# Altium schematic sheet Peripherals.SchDoc
size A4; SheetNumber: 4; SheetTotal: 6
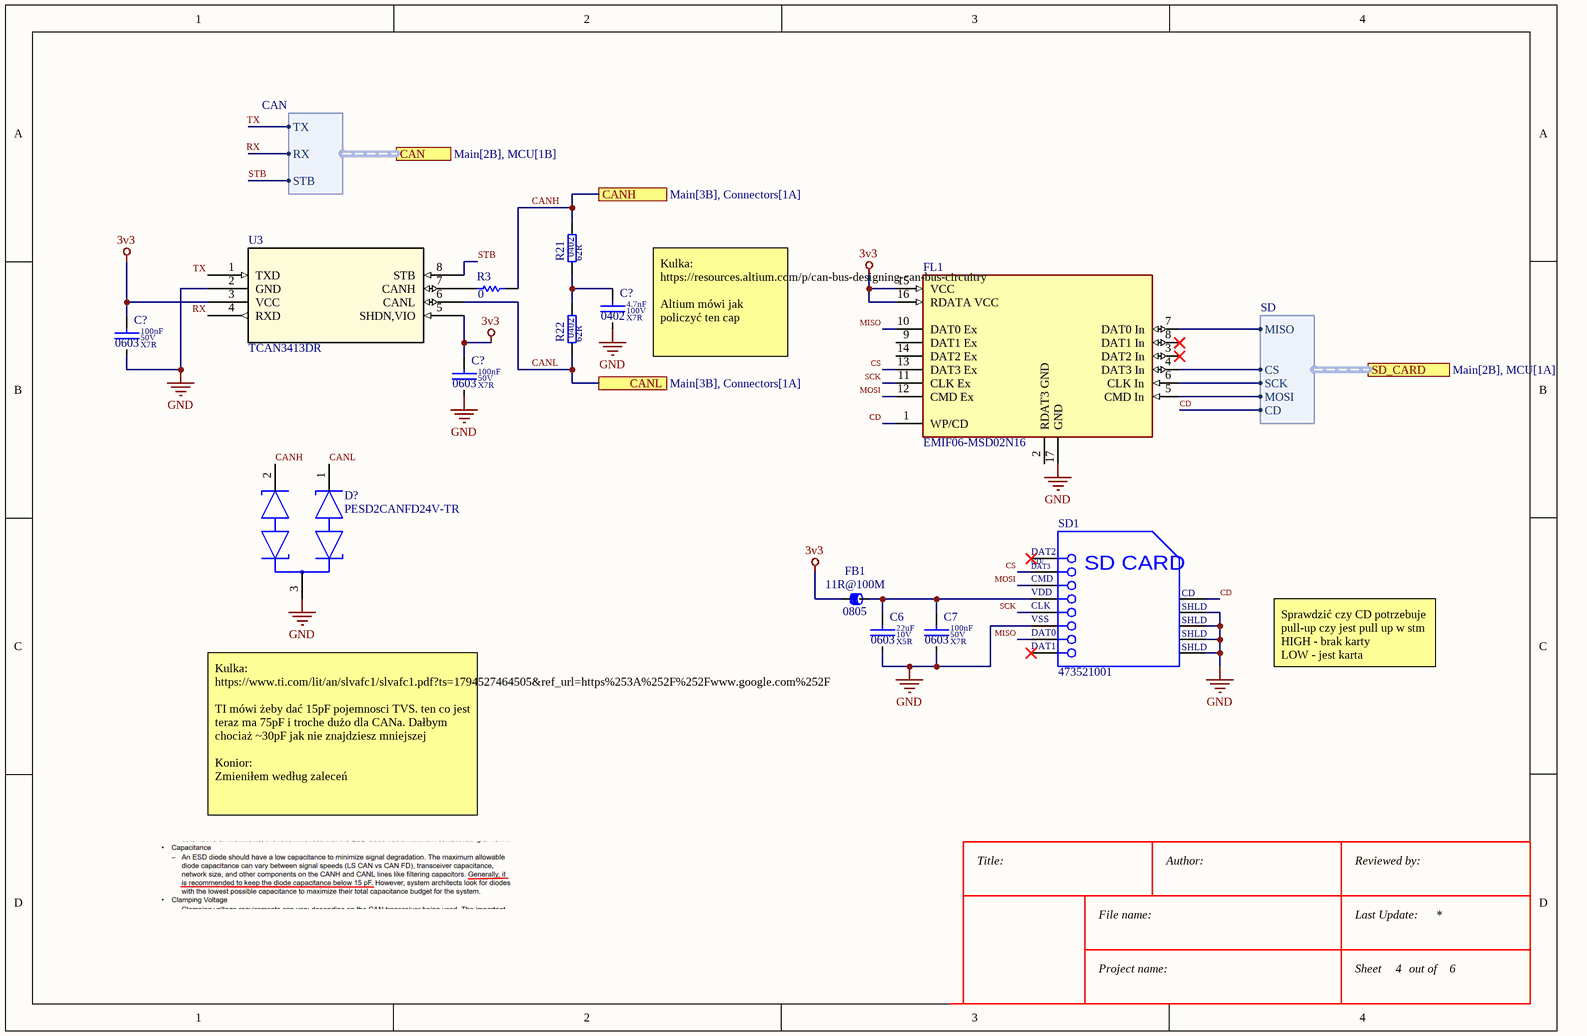
[diagram p0: Peripherals.SchDoc]

## Parts
(Parts that share a designator on the sheet are numbered #1, #2 ... from top to bottom, then left to right.)
C6  value 22uF  Dielectric: X5R  Voltage: 10V  SCH_Footprint: 0603  [C_0603_1608]  (hidden comment: Ceramic X5R)
C7  value 100nF  Dielectric: X7R  Voltage: 50V  SCH_Footprint: 0603  [C_0603_1608]  (hidden comment: Ceramic X7R)
C?#1  value 4.7nF  Dielectric: X7R  Voltage: 100V  SCH_Footprint: 0402  [C_0402_1005]  (hidden comment: Ceramic X7R)
C?#2  value 100nF  Dielectric: X7R  Voltage: 50V  SCH_Footprint: 0603  [C_0603_1608]  (hidden comment: Ceramic X7R)
C?#3  value 100nF  Dielectric: X7R  Voltage: 50V  SCH_Footprint: 0603  [C_0603_1608]  (hidden comment: Ceramic X7R)
D?  PESD2CANFD24V-TR  [FP-SOT23-IPC_A]
FB1  value 11R@100M  SCH_Footprint: 0805  [FB_0805_2012]  (hidden comment: Ferrite bead)
FL1  EMIF06-MSD02N16  [FP-EMIF06-MSD02N16-MFG]
R3  value 0  [RESC1005X40X25ML05T05]  (hidden comment: Resistor 0R +/- 5% 0402 63 mW)
R21  value 62R  SCH_Footprint: 0402  [R_0402_1005]  (hidden comment: Resistor)
R22  value 62R  SCH_Footprint: 0402  [R_0402_1005]  (hidden comment: Resistor)
SD1  473521001  [MOLX-473521001_V]
U3  TCAN3413DR  [SOIC-8_D0008A_TEX]

## Ports
CAN (harness CAN, see Main[2B], MCU[1B]), CANH (see Main[3B], Connectors[1A]), CANL (see Main[3B], Connectors[1A]), SD_CARD (harness SD, see Main[2B], MCU[1A])

## Harnesses
SD: MISO, SCK, MOSI, CD, CS
CAN: TX, RX, STB

## Nets
3v3: C?#2.1 C?#3.1 FB1.1 FL1.15(VCC) FL1.16(RDATA_VCC) U3.3(VCC) U3.5(SHDN,VIO)
GND: C6.2 C7.2 C?#1.2 C?#2.2 C?#3.2 D?.3(CC) FL1.17(GND) SD1.6(VSS) SD1.10(SHLD) SD1.11(SHLD) SD1.12(SHLD) SD1.13(SHLD) U3.2(GND)
CANH: D?.2(K2) R3.2 R21.2 ; port CANH
CANL: D?.1(K1) R22.1 U3.6(CANL) ; port CANL
CD: FL1.1(WP/CD) SD1.9(CD) ; port SD_CARD.CD
CS: FL1.13(DAT3_Ex) SD1.2(CD/DAT3)
MISO: FL1.10(DAT0_Ex) SD1.7(DAT0)
MOSI: FL1.12(CMD_Ex) SD1.3(CMD)
RX: U3.4(RXD) ; port CAN.RX
SCK: FL1.11(CLK_Ex) SD1.5(CLK)
STB: U3.8(STB) ; port CAN.STB
TX: U3.1(TXD) ; port CAN.TX
NetC6_1: C6.1 C7.1 FB1.2 SD1.4(VDD)
NetC?#1_1: C?#1.1 R21.1 R22.2
NetFL1_4: FL1.4(DAT3_In) ; port SD_CARD.CS
NetFL1_5: FL1.5(CMD_In) ; port SD_CARD.MOSI
NetFL1_6: FL1.6(CLK_In) ; port SD_CARD.SCK
NetFL1_7: FL1.7(DAT0_In) ; port SD_CARD.MISO
NetR3_1: R3.1 U3.7(CANH)

Not connected (* = marked no-connect by the designer): FL1 2(RDAT3_GND) 3(DAT2_In)* 8(DAT1_In)* 9(DAT1_Ex) 14(DAT2_Ex); SD1 1(DAT2)* 8(DAT1)*

## Notes on the sheet
- (near C?#1) Kulka: https://resources.altium.com/p/can-bus-designing-can-bus-circuitry
  Altium mówi jak policzyć ten cap
- Sprawdzić czy CD potrzebuje pull-up czy jest pull up w stm
  HIGH - brak karty
  LOW - jest karta
- Kulka:
  https://www.ti.com/lit/an/slvafc1/slvafc1.pdf?ts=1794527464505&ref_url=https%253A%252F%252Fwww.google.com%252F
  TI mówi żeby dać 15pF pojemnosci TVS. ten co jest teraz ma 75pF i troche dużo dla CANa. Dałbym chociaż ~30pF jak nie znajdziesz mniejszej
  Konior:
  Zmieniłem według zaleceń
- Title:
- File name:
- Author:
- Reviewed by:
- Last Update:
- Project name:
- Sheet
- out of
- (in symbol CMP-2000-05848-1) CD/; DAT3; SD CARD

## Library data of the parts
C6 = C_22uF_10V_X5R_0603_20: Capacitor; Manufacturer: Murata; Manufacturer Part Number: GRM188R61A226ME15D; Tolerance (%): 20; Part Number: C_22uF_10V_X5R_0603_20; HelpURL: https://www.mouser.pl/datasheet/2/281/1/GRM188R61A226ME15_02A-1985787.pdf; Supplier 1: TME; Supplier Part Number 1: GRM188R61A226ME15D; Supplier 2: RS Components; Supplier 3: Farnell; Supplier Part Number 3: 2426957; Supplier 4: Mouser; Supplier Part Number 4: 81-GRM188R61A226ME5D; Supplier 5: Digi-Key; Supplier Part Number 5: 490-10476-1-ND; Supplier 6: LCSC
C7 C?#2 C?#3 = C_100nF_50V_X7R_0603_10_AECQ1: Capacitor; Manufacturer: Murata; Manufacturer Part Number: GCM188R71H104KA57D; Tolerance (%): 10; AEC-Q: 1; Part Number: C_100nF_50V_X7R_0603_10_AECQ1; HelpURL: https://www.murata.com/products/productdetail?partno=GCM188R71H104KA57%23; Supplier 1: TME; Supplier Part Number 1: GCM188R71H104KA57D; Supplier 2: RS Components; Supplier 3: Farnell; Supplier Part Number 3: 4360223; Supplier 4: Mouser; Supplier Part Number 4: 81-GCM188R71H104KA7D; Supplier 5: Digi-Key; Supplier Part Number 5: 490-4779-1-ND; Supplier 6: LCSC; Supplier Part Number 6: C85864
C?#1 = C_4.7nF_100V_X7R_0402_10: Capacitor; Manufacturer: Murata; Manufacturer Part Number: GRM155R72A472KA01D; Tolerance (%): 10; Part Number: C_4.7nF_100V_X7R_0402_10; HelpURL: https://www.murata.com/en-global/api/pdfdownloadapi?cate=luCeramicCapacitorsSMD&partno=GRM155R72A472KA01%23; Supplier 1: TME; Supplier Part Number 1: GRM155R72A472KA01D; Supplier 2: RS Components; Supplier 3: Farnell; Supplier Part Number 3: 3582820; Supplier 4: Mouser; Supplier Part Number 4: 81-GRM155R72A472KA01; Supplier 5: Digi-Key; Supplier Part Number 5: 490-3885-1-ND; Supplier 6: LCSC; Supplier Part Number 6: C415704
D? = CMP-14436-000014-1: TVS DIODE 24VWM 42VC TO236AB
FB1 = FB_2508051107Y0: Manufacturer: Fair-Rite; Current: 300mA; Resistance: 100mR; Part Number: FB_2508051107Y0; HelpURL: https://datasheet.octopart.com/2508051107Y0-Fair-Rite-datasheet-834.pdf; Manufacturer Part Number: 2508051107Y0; Supplier 1: TME; Supplier 2: RS Components; Supplier 3: Farnell; Supplier Part Number 3: 1612004; Supplier 4: Mouser; Supplier Part Number 4: 623-2508051107Y0; Supplier 5: Digi-Key; Supplier Part Number 5: 1934-1397-1-ND; Supplier 6: LCSC
FL1 = CMP-12221-000004-1: FILTER RC(PI) 45 OHM/20PF SMD; Max Breakdown Voltage: 8V; Number of Channels: 6; Capacitance: 20pF; ESD Protection: Yes; Min Operating Temperature: -30°C; Contact Plating: Gold; Width: 0.047inch; Package Quantity: 1; Length: 3.55mm; Mount: Surface Mount; Breakdown Voltage: 8V; Max Operating Temperature: 85°C; REACH SVHC: No SVHC; Radiation Hardening: No; Depth: 1.25mm; Number of Pins: 16; Height: 0.022inch; Termination: Flat; Packaging: Tape and Reel; Case/Package: QFN; Lead Free: Lead Free
R3 = CMP-009-00003-5: Chip Resistor, 0 Ohm, +/- 5%, 63 mW, -55 to 155 degC, 0402 (1005 Metric); Power: 63mW; Voltage Rating: 50V; RoHS Compliant: True; Max Operating Temperature: 155°C; Mounting Technology: SM; Min Operating Temperature: -55°C; Tolerance: 5%; Case/Package: 0402; Pins: 2
R21 R22 = R_62R_0402_1_AECQ0: Manufacturer: Panasonic; Manufacturer Part Number: ERJ-2RKF62R0X; Voltage: 50V; Power: 100mW; Tolerance: 1%; AEC-Q: 0; Part Number: R_62R_0402_1_AECQ0; HelpURL: https://industrial.panasonic.com/cdbs/www-data/pdf/RDA0000/AOA0000C304.pdf; Supplier 1: TME; Supplier Part Number 1: ERJ2RKF62R0X; Supplier 2: RS Components; Supplier 3: Farnell; Supplier Part Number 3: 4137006; Supplier 4: Mouser; Supplier Part Number 4: 667-ERJ-2RKF62R0X; Supplier 5: Digi-Key; Supplier Part Number 5: P62.0LCT-ND; Supplier 6: LCSC
SD1 = CMP-2000-05848-1: MicroSD(TM), Pitch 1.1 mm, 8 Position, Height 1.88 mm, -20 to 85 degC, RoHS, Tape and Reel; Manufacturer: Molex; Datasheet Version: Rev. G, 01/2012; Datasheet URL: http://www.molex.com/pdm_docs/sd/473521001_sd.pdf; Package Reference: 473521001; Manufacturer URL: http://www.molex.com/; Mounting Technology: SurfaceMount; Package Description: MicroSD(TM), Pitch 1.1 mm, 8 Position, Height 1.88 mm
U3 = TCAN3413DR: 3.3-V CAN FD transceiver with flexible IO and standby mode 8-SOIC -40 to 125; Manufacturer_Name: Texas Instruments; Copyright: Copyright (C) 2026 Ultra Librarian. All rights reserved.; Manufacturer_Part_Number: TCAN3413DR; Datasheet: https://www.ti.com/lit/gpn/tcan3413; RefDes: RefDes; Type: Type